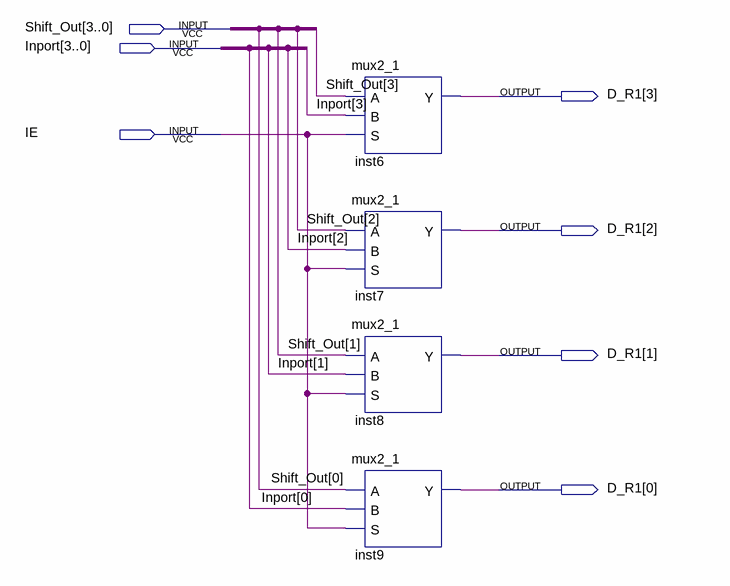
[diagram p0: schematic sheet]
// Quartus schematic D_R1.bdf as structural Verilog: 4 symbols, 7 pins
module D_R1 (
  input  [3:0] Shift_Out,
  input  [3:0] Inport,
  input  IE,
  output [3:0] D_R1
);

  mux2_1 inst6 (.A(Shift_Out[3]), .B(Inport[3]), .S(IE), .Y(D_R1[3]));
  mux2_1 inst7 (.A(Shift_Out[2]), .B(Inport[2]), .S(IE), .Y(D_R1[2]));
  mux2_1 inst8 (.A(Shift_Out[1]), .B(Inport[1]), .S(IE), .Y(D_R1[1]));
  mux2_1 inst9 (.A(Shift_Out[0]), .B(Inport[0]), .S(IE), .Y(D_R1[0]));
endmodule
